# Altium schematic sheet cover.SchDoc: ESP32-Titans-Dev_kit
size 420 x 297 mm; Date: 13/10/2026; ApprovedBy: M. Luiz; CheckedBy: M. Luiz; Author: M. Luiz; CompanyName: Equipe de Robótica Titans; DrawnBy: M. Luiz; Engineer: M. Luiz; Organization: Equipe de Robótica Titans; DocumentNumber: 1; Revision: A; SheetNumber: 1; SheetTotal: 5; Projeto: Curso Altium
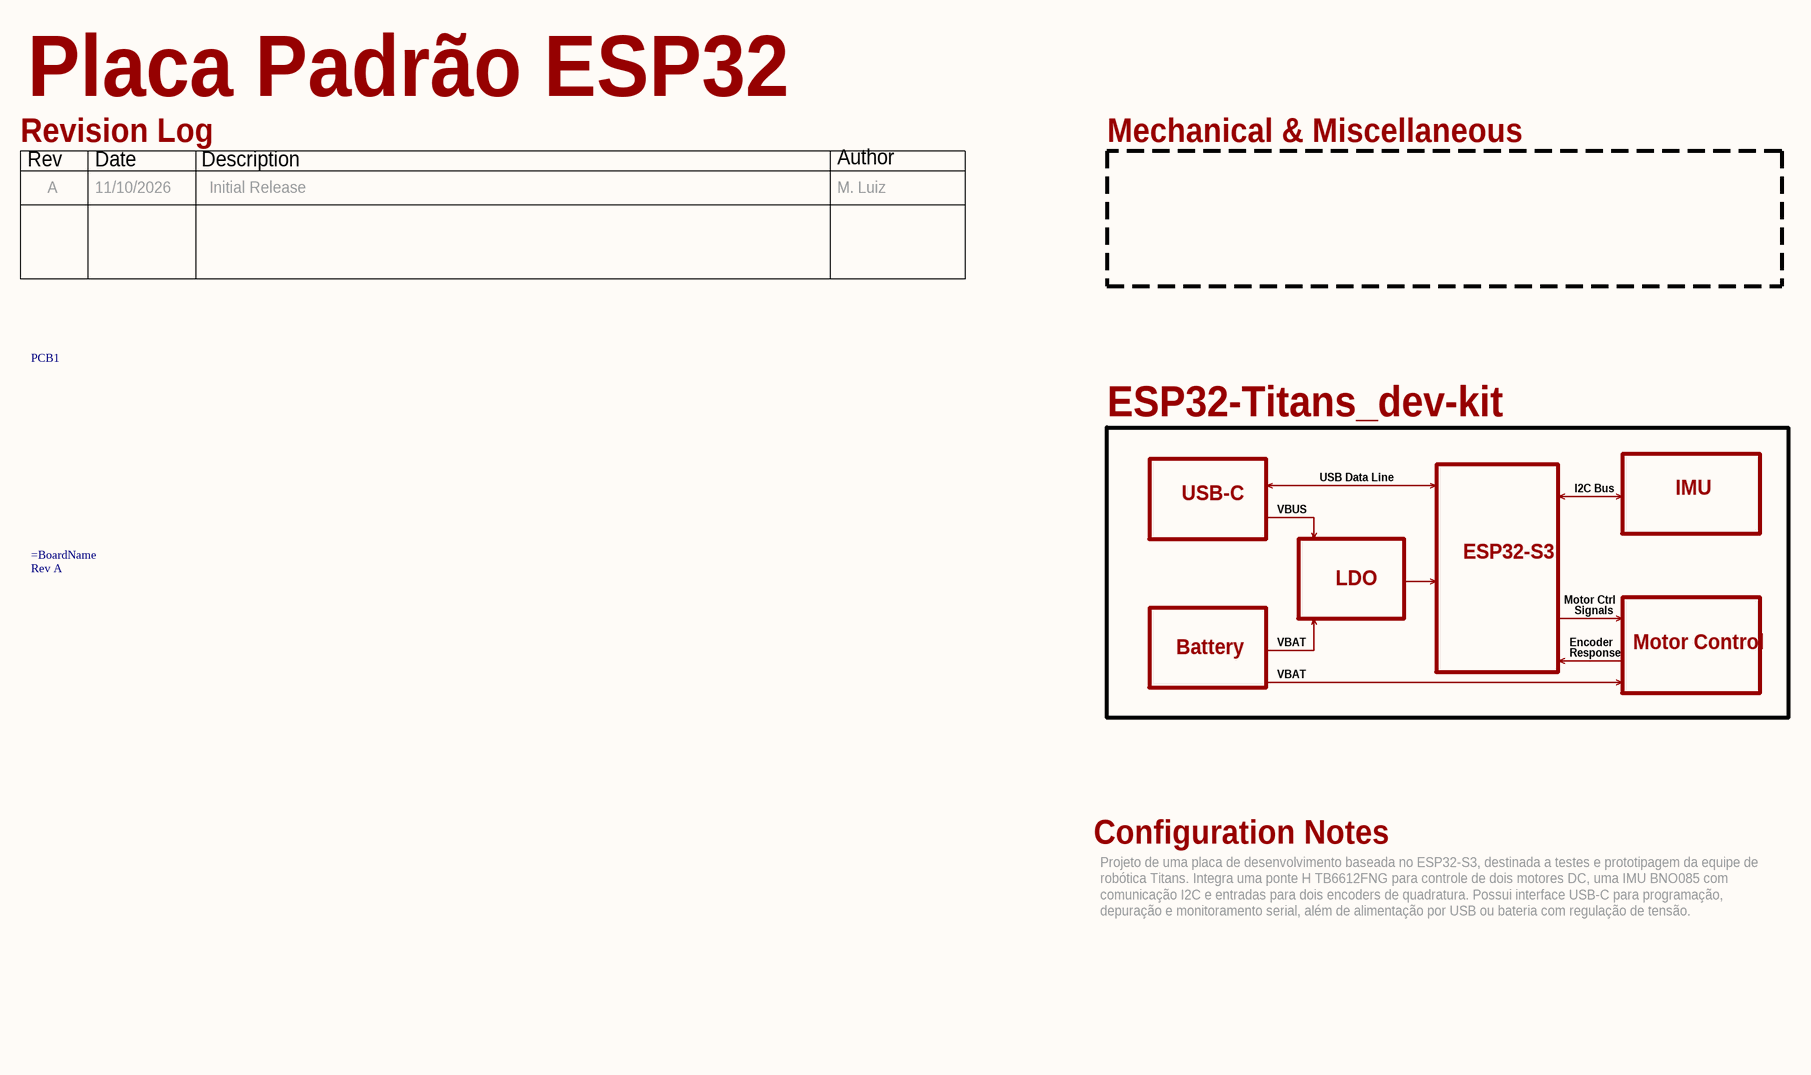
[diagram p0: cover.SchDoc]

## Parts
PCB1  Board Revision: Rev A  [PCB_Logo]  (no BOM)

## Sub-sheets
ESP32-Titans_dev-kit = block_diagram.SchDoc: no entries

## Notes on the sheet
- Revision Log
- Placa Padrão ESP32
- Mechanical & Miscellaneous
- Rev
- A
- Date
- 11/10/2026
- Description
- Initial Release
- Author
- M. Luiz
- USB Data Line
- I2C Bus
- IMU
- USB-C
- VBUS
- ESP32-S3
- LDO
- Motor Ctrl
- Signals
- Battery
- VBAT
- Encoder
- Response
- Motor Control
- Configuration Notes
- Projeto de uma placa de desenvolvimento baseada no ESP32-S3, destinada a testes e prototipagem da equipe de robótica Titans. Integra uma ponte H TB6612FNG para controle de dois motores DC, uma IMU BNO085 com comunicação I2C e entradas para dois encoders de quadratura. Possui interface USB-C para programação, depuração e monitoramento serial, além de alimentação por USB ou bateria com regulação de tensão.
- Título:
- Equipe de Robótica Titans
- Projeto:
- Autor:
- Número:
- Aprovado por:
- Revisão:
- Data:
- Última Modificação:
- Página
- De

## Library data of the parts
PCB1 = BOARD INFO: Not Assembled PCB Component; Project Name: =BoardName